# EAGLE design window-opener (EAGLE 9.7.0)
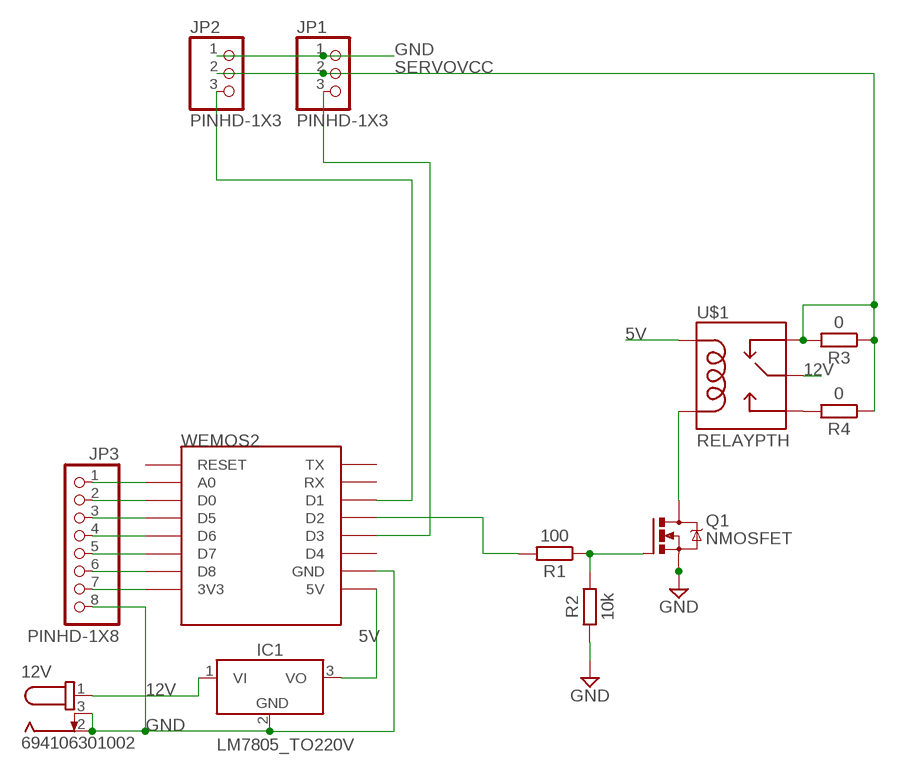
[diagram p0: schematic, sheet 1]

## Parts
12V  694106301002  [694106301002]
IC1  LM7805_TO220V  [TO220V]
JP1  PINHD-1X3  [1X03]
JP2  PINHD-1X3  [1X03]
JP3  PINHD-1X8  [1X08]
Q1  NMOSFET  NMOSFETSOT23-GSD  [SOT23]
R1  100  R_CHIP-0805(2012-METRIC)  [RESC2012X65]
R2  10k  R_CHIP-0805(2012-METRIC)  [RESC2012X65]
R3  0  R_CHIP-0805(2012-METRIC)  [RESC2012X65]
R4  0  R_CHIP-0805(2012-METRIC)  [RESC2012X65]
U$1  RELAYPTH  [SRD-05VDC-SL-C]
WEMOS2  WEMOS-D1-MINI  [WEMOS-D1-MINI]

## Nets
5V: IC1.3(VO) U$1.COIL1 WEMOS2.5V
12V: 12V.1 IC1.1(VI) U$1.SWCOMMON
GND: 12V.2 12V.3 IC1.2(GND) JP1.1 JP2.1 JP3.8 Q1.2(S) R2.1 WEMOS2.GND
N$1: Q1.1(G) R1.1 R2.2
N$2: JP2.3 WEMOS2.D1
N$3: JP3.1 WEMOS2.A0
N$4: JP1.3 WEMOS2.D3
N$5: R1.2 WEMOS2.D2
N$6: JP3.2 WEMOS2.D0
N$7: JP3.3 WEMOS2.D5
N$8: JP3.4 WEMOS2.D6
N$9: JP3.5 WEMOS2.D7
N$10: JP3.6 WEMOS2.D8
N$11: JP3.7 WEMOS2.3V3
N$13: R4.2 U$1.SWOPEN
R: Q1.3(D) U$1.COIL0
SERVOVCC: JP1.2 JP2.2 R3.1 R3.2 R4.1 U$1.SWCLOSED(SWCLOSE)
Unconnected: WEMOS2.D4 WEMOS2.RESET WEMOS2.RX WEMOS2.TX

## Library data of the parts
12V = DC Power Jacks:694106301002: CONN PWR JACK 2.1X5.5MM SOLDER Manufacturer's datasheet <https://katalog.we-online.de/em/datasheet/6941xx301002.pdf>; CREATED_BY: PCBLayout.com; DIGIKEY_PART_NUMBER: 732-5930-ND; MANUFACTURER: Wurth Electronics Inc.; MPN: 694106301002
IC1 = IC_Power-Management:LM7805: 5V Voltage Regulator Reference Datasheet <https://www.ti.com/lit/ds/symlink/lm340.pdf>; CATEGORY: IC_Linear; DESCRIPTION: 5V Voltage Regulator; MANUFACTURER: Generic; MPN: Generic; SERIES: LM7805; SUB-CATEGORY: Voltage Regulator; TYPE: 5V
JP1 JP2 = Connector:PINHD-1X3: PIN HEADER; CATEGORY: Headers; DESCRIPTION: Header, Straight, 3 Position; MANUFACTURER: Generic; MPN: Generic; OPERATING_TEMPERATURE: Generic; PART_STATUS: Active; PITCH: 0.100" (2.54mm); ROHS_COMPLIANCE: Generic; SERIES: Generic; SUB-CATEGORY: Headers, Male Pins; TYPE: Board to Board or Cable, Unshrouded, Through Hole, Straight
JP3 = Connector:PINHD-1X8: PIN HEADER; CATEGORY: Headers; DESCRIPTION: Header, Straight, 8 Position; MANUFACTURER: Generic; MPN: Generic; OPERATING_TEMPERATURE: Generic; PART_STATUS: Active; PITCH: 0.100" (2.54mm); ROHS_COMPLIANCE: Generic; SERIES: Generic; SUB-CATEGORY: Headers, Male Pins; TYPE: Board to Board or Cable, Unshrouded, Through Hole, Straight
Q1 = Transistor:NMOSFET: N-Channel MOSFET - Generic; CATEGORY: Transistor; SUB-CATEGORY: MOSFET; TYPE: N-Channel
R1-R4 = Resistor:R: Resistor Fixed - Generic; CATEGORY: Resistor; SUB-CATEGORY: Fixed
U$1 = SRD-05VDC-SL-C:RELAY: SPDT relay (COM-00101)
WEMOS2 = WemosD1-Dummy:WEMOS-D1-MINI: WeMos.cc D1 mini ESP8266 module

## Board
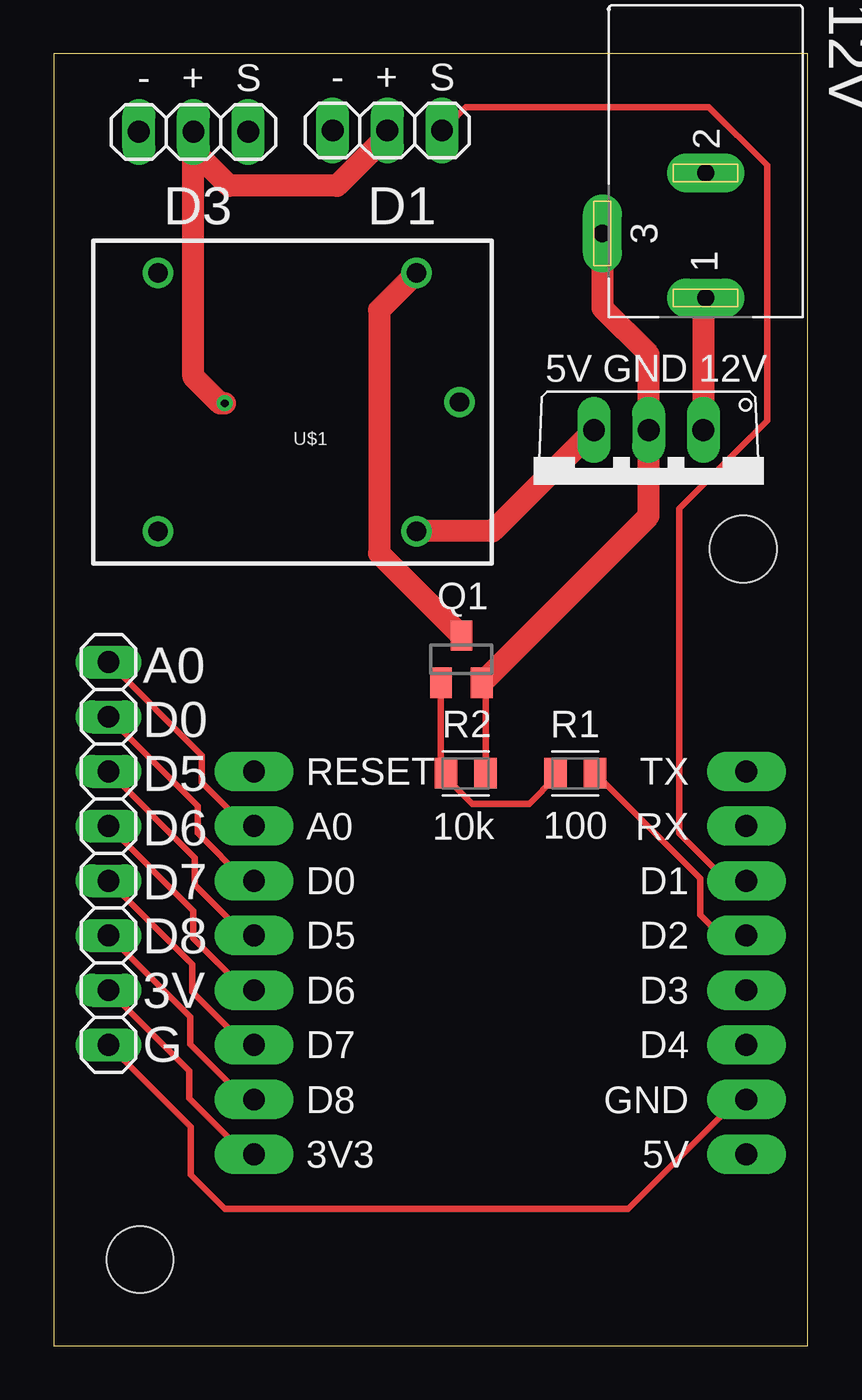
[diagram p1: board, top side]
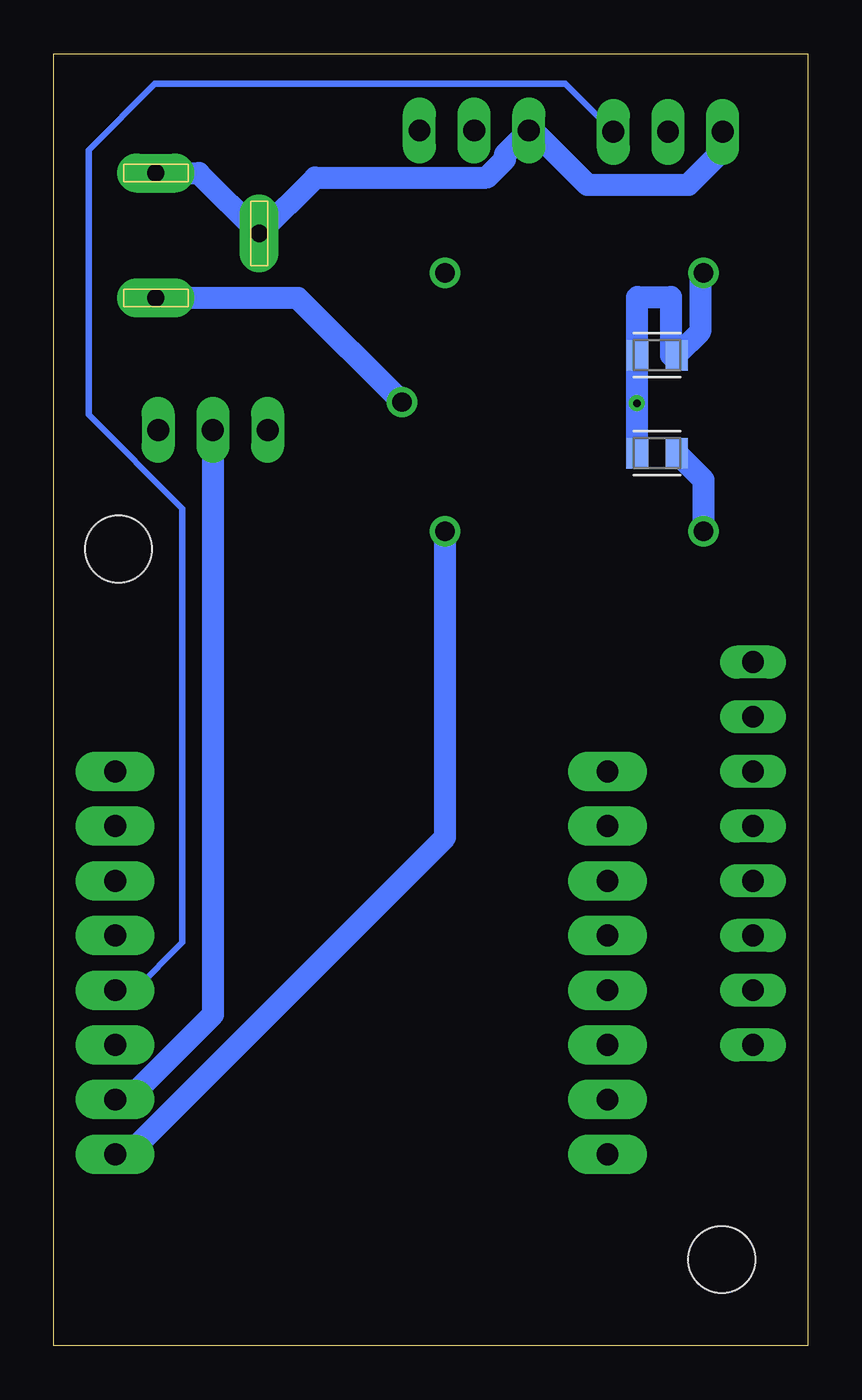
[diagram p2: board, bottom side, seen from below]

Size 35 x 60 mm. Coordinates in mm from the lower left corner, seen from the top.
Outline: 25.06,50.16 25.06,53.16 25.86,53.16 25.86,50.16 25.06,50.16
Outline: 28.76,48.26 28.76,49.06 31.76,49.06 31.76,48.26 28.76,48.26
Outline: 28.76,54.06 28.76,54.86 31.76,54.86 31.76,54.06 28.76,54.06
Outline: 0,60 0,0 35,0 35,60 0,60
Copper layers (1*16): Top 0.035mm / dielectric 1.5mm / Bottom 0.035mm
Design rules "Fusion Electronics Design Rules": minimum track width 6mil, minimum drill 0.35mm, track to track 6mil, track to pad 6mil, pad to pad 6mil, via to via 6mil, smd to smd 6mil, copper to edge 40mil, drill to drill 6mil, minimum pad ring 10mil, minimum via ring 8mil, stop-mask expansion 4mil, vias tented up to drill 0mil, thermal gap 10mil
Holes 3.1 mm at 32,37 4,4

### Footprints (pad centres in the part's own frame; a part is rotated, then mirrored left to right if it is on the bottom)
694106301002 = drill 0.8 pad 1.8 long: 1 13.6,0; 2 7.8,0; 3 10.6,-4.8
TO220V = drill 1.016 long: 1 -2.54,-2.54; 2 0,-2.54; 3 2.54,-2.54
1X03 = drill 1.016 long: 1 -2.54,0; 2 0,0; 3 2.54,0
1X08 = drill 1.016 long: 1 -8.89,0; 2 -6.35,0; 3 -3.81,0; 4 -1.27,0; 5 1.27,0; 6 3.81,0; 7 6.35,0; 8 8.89,0
SOT23 = smd 1 x 1.4: 1 -0.95,-1.1; 2 0.95,-1.1; 3 0,1.1
RESC2012X65 = smd 1.031 x 1.42: 1 -0.919,0; 2 0.919,0
SRD-05VDC-SL-C = drill 0.9: COIL0 -5.39,-6.12; COIL1 -5.39,5.88; SWCLOSED 6.61,-6.12; SWCOMMON -7.39,-0.12; SWOPEN 6.61,5.88
WEMOS-D1-MINI = drill 1.016 pad 1.829 long: 3V3 -10.16,-10.16; 5V 12.7,-10.16; A0 -10.16,5.08; D0 -10.16,2.54; D1 12.7,2.54; D2 12.7,0; D3 12.7,-2.54; D4 12.7,-5.08; D5 -10.16,0; D6 -10.16,-2.54; D7 -10.16,-5.08; D8 -10.16,-7.62; GND 12.7,-7.62; RESET -10.16,7.62; RX 12.7,5.08; TX 12.7,7.62

### Placement (x,y rotation side)
12V  30.26,62.26 270 top
IC1  27.62,39.99 180 top
JP1  6.48,56.38 0 top
JP2  15.48,56.44 0 top
JP3  2.54,22.86 270 top
Q1  18.92,31.89 0 top
R1  24.21,26.58 0 top
R2  19.13,26.58 180 top
R3  7,46 180 bottom
R4  7,41.45 0 bottom
U$1  11.44,43.7 180 top
WEMOS2  19.46,19.05 0 top

### Tracks (layer width: path | path; a pad name or v marks a point on that pad's centre or on a via)
5V
  Top 1.016: IC1.3 20.37,37.82 U$1.COIL1
  Bottom 1.016: U$1.COIL1 16.83,23.61 31.55,8.89 WEMOS2.5V
12V
  Top 1.016: 12V.1 30.16,48.56 IC1.1
  Bottom 1.016: U$1.SWCOMMON 23.67,48.66 12V.1
GND
  Top 0.305: JP3.8 6.35,10.16 6.35,7.93 7.93,6.35 26.67,6.35 31.75,11.43 WEMOS2.GND | Q1.2 20.05,30.61 R2.1
  Top 1.016: Q1.2 27.62,38.54 IC1.2 27.62,46.04 25.46,48.2 12V.3
  Bottom 1.016: JP1.1 3.94,55.51 5.54,53.92 10.23,53.92 12.75,56.44 JP2.1 14.06,55.32 14.06,55.09 14.89,54.26 22.87,54.26 12V.3 28.26,54.46 12V.2 | IC1.2 27.62,15.37 31.55,11.43 WEMOS2.GND
N$1
  Top 0.305: Q1.1 17.97,27.14 18.21,26.9 R2.2 18.21,26.39 19.43,25.17 22.06,25.17 23.29,26.39 R1.1
N$2
  Top 0.305: JP2.3 19.11,57.53 30.41,57.53 33.11,54.83 33.11,42.95 29.03,38.88 29.03,23.8 31.24,21.59 WEMOS2.D1
N$3
  Top 0.305: JP3.1 6.87,27.42 6.87,26.15 8.89,24.13 WEMOS2.A0
N$4
  Bottom 0.305: WEMOS2.D3 31.24,16.51 29.03,18.72 29.03,38.88 33.39,43.23 33.39,55.53 30.32,58.6 11.25,58.6 JP1.3
N$5
  Top 0.305: R1.2 30,21.71 30,20 30.95,19.05 WEMOS2.D2
N$6
  Top 0.305: JP3.2 6.68,25.07 6.68,23.8 8.89,21.59 WEMOS2.D0
N$7
  Top 0.305: JP3.3 6.55,22.66 6.55,21.39 8.89,19.05 WEMOS2.D5
N$8
  Top 0.305: JP3.4 6.48,20.19 6.48,18.92 8.89,16.51 WEMOS2.D6
N$9
  Top 0.305: JP3.5 6.42,17.71 6.42,16.44 8.89,13.97 WEMOS2.D7
N$10
  Top 0.305: JP3.6 6.32,15.27 6.32,14 8.89,11.43 WEMOS2.D8
N$11
  Top 0.305: JP3.7 6.29,12.76 6.29,11.49 8.89,8.89 WEMOS2.3V3
N$13
  Bottom 1.016: U$1.SWOPEN 4.83,40.2 R4.2
R
  Top 1.016: U$1.COIL0 15.11,48.1 15.11,36.8 Q1.3
SERVOVCC  (via drill 0.35)
  Top 1.016: JP2.2 15.6,56.32 13.15,53.87 8.13,53.87 6.48,55.51 JP1.2 6.48,45 7.71,43.77 v7.93,43.77
  Bottom 1.016: U$1.SWCLOSED 5,49.66 5,47.08 R3.1 6.36,46 6.36,48.71 7.9,48.71 7.92,48.69 R3.2 7.93,45.98 v7.93,43.77 7.93,41.47 R4.1

### Text on the board
tNames: - + S | - + S | D3 D1 | 5V GND 12V | A0 / D0 / D5 / D6 / D7 / D8 / 3V / G